# Altium schematic sheet Level-Shifter-Section.SchDoc
size A4; SheetNumber: 6
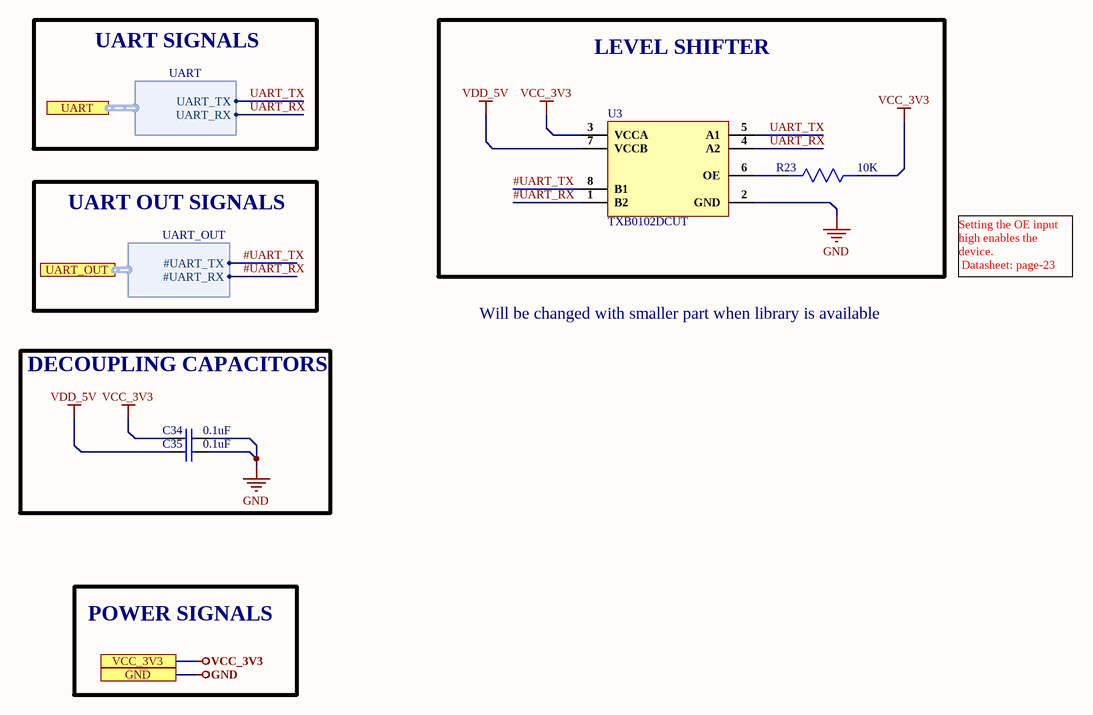
[diagram p0: Level-Shifter-Section.SchDoc]

## Parts
C34  0.1uF  [Cap0603]
C35  0.1uF  [Cap0603]
R23  10K  [Res0603]
U3  TXB0102DCUT  [TXB0102DCUT]

## Blocks framed on the sheet
LEVEL SHIFTER: R23 U3
DECOUPLING CAPACITORS: C34 C35

## Ports
GND, UART (harness UART), UART_OUT (harness UART_OUT), VCC_3V3

## Harnesses
UART: UART_TX, UART_RX
UART_OUT: #UART_TX, #UART_RX

## Nets
GND: C34.2 C35.2 U3.2(GND) ; port GND
VCC_3V3: C34.1 R23.1 U3.3(VCCA) ; port VCC_3V3
VDD_5V: C35.1 U3.7(VCCB)
#UART_RX: U3.1(B2) ; port UART_OUT.#UART_RX
#UART_TX: U3.8(B1) ; port UART_OUT.#UART_TX
UART_RX: U3.4(A2) ; port UART.UART_RX
UART_TX: U3.5(A1) ; port UART.UART_TX
NetR23_2: R23.2 U3.6(OE)

## Notes on the sheet
- UART SIGNALS
- UART OUT SIGNALS
- Will be changed with smaller part when library is available
- Setting the OE input high enables the device.
  Datasheet: page-23
- POWER SIGNALS

## Library data of the parts
C34 C35 = CC0603KRX7R0BB104: CAP CER 0.1UF 100V X7R 0603; Manufacturer: Yageo; Capacitance: 100nF; Tolerance: 10%; Supplier 1: Digi-Key; Manufacturer Part Number: CC0603KRX7R0BB104; RoHS: Yes; Category: Ceramic Capacitors; Stock 1: 60476; Pricing 1: 1=0.19000, 10=0.13500, 50=0.07680, 100=0.06370, 500=0.04466, 1000=0.03696 (USD); Mount: Surface Mount; Case/Package: 0603; Case Code (Metric): 1608; Case Code (Imperial): 0603; Weight: 7.1E-05oz; Min Operating Temperature: -55°C; Max Operating Temperature: 125°C; Package Quantity: 4000; Voltage Rating: 100V; Packaging: Tape and Reel; Dielectric: X7R; Termination: SMD/SMT; Resistor Type: Ceramic; Voltage Rating (DC): 100V; Series: CC; Length: 0.063inch; Width: 0.031inch; Thickness: 0.035inch; Depth: 0.8mm; Lead Free: Lead Free; RoHS Compliant: Yes; ComponentLink1URL: https://datasheet.ciiva.com/6277/mlccorderingcode-6277030.pdf?src-supplier=Digi-Key; ComponentLink1Description: https://datasheet.ciiva.com/6277/mlccorderingcode-6277030.pdf?src-supplier=Digi-Key; ComponentLink2URL: https://datasheet.ciiva.com/6277/mlccorderingcode-6277081.pdf?src-supplier=Digi-Key; ComponentLink2Description: https://datasheet.ciiva.com/6277/mlccorderingcode-6277081.pdf?src-supplier=Digi-Key; ComponentLink3URL: https://datasheet.ciiva.com/6277/mlccorderingcode-6277082.pdf?src-supplier=Digi-Key; ComponentLink3Description: https://datasheet.ciiva.com/6277/mlccorderingcode-6277082.pdf?src-supplier=Digi-Key; Supplier Part Number 1: 311-1523-1-ND
R23 = AC0603JR-0710KL: RES SMD 10K OHM 5% 1/10W 0603; Manufacturer: Yageo; Voltage Rating: 50V; Resistance: 10kR; Power Rating: 100mW; Temperature Coefficient: 100ppm/°C; Supplier 1: Future Electronics; Manufacturer Part Number: AC0603JR-0710KL; RoHS: Yes; Category: Chip SMD Resistors; Stock 1: 1533000; Pricing 1: 5000=0.00540 (USD); Case/Package: 0603; Case Code (Imperial): 0603; Case Code (Metric): 1608; Size Code: 0603; Min Operating Temperature: -55°C; Max Operating Temperature: 155°C; Packaging: Tape and Reel; Tolerance: 5%; Package Quantity: 1; Resistor Type: Thick Film; Termination: SMD/SMT; Number of Terminations: 2; Max Power Dissipation: 100mW; Features: Moisture Resistant,Automotive AEC-Q200,Anti-Sulfur; Series: AC; Construction: Rectangular; Length: 0.063inch; Width: 0.031inch; Height: 0.022inch; Depth: 0.8mm; Military Standard: Not; Lead Free: Lead Free; RoHS Compliant: Yes; ComponentLink1URL: https://datasheet.ciiva.com/5562/pyu-ac-51-rohs-l-2-5562553.pdf?src-supplier=Mouser; ComponentLink1Description: https://datasheet.ciiva.com/5562/pyu-ac-51-rohs-l-2-5562553.pdf?src-supplier=Mouser; Supplier Part Number 1: 1029044
U3 = TXB0102DCUT: IC TRNSLTR BIDIRECTIONAL US8; Manufacturer: Texas Instruments; Propagation Delay: 31ns; Min Supply Voltage: 1.65V; Max Supply Voltage: 5.5V; Data Rate: 100Mbps; Number of Channels: 2; Logic Function: Translator; Turn-On Delay Time: 7.4ns; High Level Output Current: -20uA; Low Level Output Current: 20uA; Output Type: 3-STATE; Output Current: 50mA; Supplier 1: Arrow Electronics; Manufacturer Part Number: TXB0102DCUT; RoHS: Yes; Category: Integrated Circuits (ICs); Stock 1: 10; Pricing 1: 1=0.79330, 10=0.66470, 25=0.65820, 250=0.37450, 500=0.36200, 1000=0.29770, 2500=0.28440 (USD); Mount: Surface Mount; Case/Package: VSSOP; Number of Pins: 8; Weight: 0.000339oz; Contact Plating: Gold; Min Operating Temperature: -40°C; Max Operating Temperature: 85°C; Packaging: Tape and Reel; Package Quantity: 1; Number of Bits: 2; Series: -; Number of Inputs: 2; Length: 2.3mm; Width: 2mm; Height: 0.85mm; Radiation Hardening: No; Lead Free: Lead Free; RoHS Compliant: Yes; REACH SVHC: No SVHC; ComponentLink1URL: https://datasheet.ciiva.com/4226/sces641b-4226901.pdf?src-supplier=Arrow+Electronics; ComponentLink1Description: https://datasheet.ciiva.com/4226/sces641b-4226901.pdf?src-supplier=Arrow+Electronics; ComponentLink2URL: https://datasheet.ciiva.com/15096/getdatasheetpartid-226009-15096242.pdf?src-supplier=Verical; ComponentLink2Description: https://datasheet.ciiva.com/15096/getdatasheetpartid-226009-15096242.pdf?src-supplier=Verical; ComponentLink3URL: https://datasheet.ciiva.com/14287/txb0102-14287498.pdf?src-supplier=Avnet; ComponentLink3Description: https://datasheet.ciiva.com/14287/txb0102-14287498.pdf?src-supplier=Avnet; ComponentLink4URL: https://datasheet.ciiva.com/14287/txb0102-14287370.pdf?src-supplier=Avnet; ComponentLink4Description: https://datasheet.ciiva.com/14287/txb0102-14287370.pdf?src-supplier=Avnet; ComponentLink5URL: https://datasheet.ciiva.com/6619/txb0102-6619255.pdf?src-supplier=Digi-Key; ComponentLink5Description: https://datasheet.ciiva.com/6619/txb0102-6619255.pdf?src-supplier=Digi-Key; ComponentLink6URL: https://datasheet.ciiva.com/6619/txb0102-6619256.pdf?src-supplier=Digi-Key; ComponentLink6Description: https://datasheet.ciiva.com/6619/txb0102-6619256.pdf?src-supplier=Digi-Key; ComponentLink7URL: https://datasheet.ciiva.com/6619/txb0102-6619257.pdf?src-supplier=Digi-Key; ComponentLink7Description: https://datasheet.ciiva.com/6619/txb0102-6619257.pdf?src-supplier=Digi-Key; Supplier Part Number 1: TXB0102DCUT